# Altium schematic sheet ESP32.SchDoc
size A; SheetNumber: 6; SheetTotal: 9
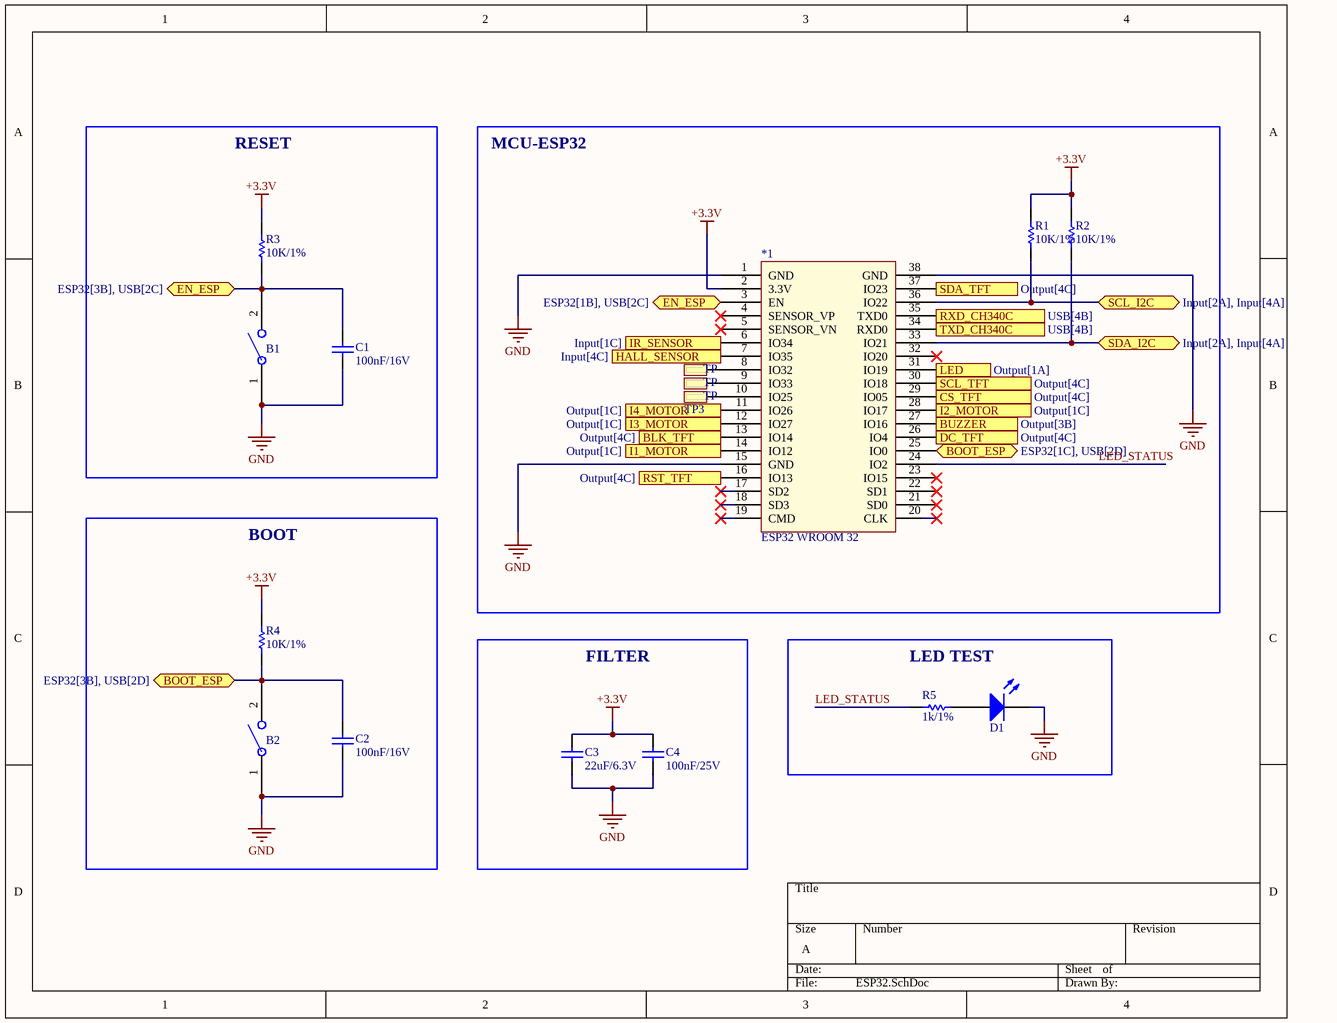
[diagram p0: ESP32.SchDoc]

## Parts
*1  ESP32 WROOM 32  [ESP32-WROOM-32D]
B1  Button SMD 2 Pin 3x4mm  [BUTTON SMD 2 PIN]  (value not drawn)
B2  Button SMD 2 Pin 3x4mm  [BUTTON SMD 2 PIN]  (value not drawn)
C1  value 100nF/16V  [CAP-SM-0805]  (hidden comment: Cap Non-Pol SMD)
C2  value 100nF/16V  [CAP-SM-0805]  (hidden comment: Cap Non-Pol SMD)
C3  value 22uF/6.3V  [CAP-SM-0805]  (hidden comment: Cap Non-Pol SMD)
C4  value 100nF/25V  [CAP-SM-0805]  (hidden comment: Cap Non-Pol SMD)
D1  LED SMD  [LED_0805_Blue]  (value not drawn)
R1  value 10K/1%  [RES-SM-0805]  (hidden comment: RESISTOR SMD)
R2  value 10K/1%  [RES-SM-0805]  (hidden comment: RESISTOR SMD)
R3  value 10K/1%  [RES-SM-0805]  (hidden comment: RESISTOR SMD)
R4  value 10K/1%  [RES-SM-0805]  (hidden comment: RESISTOR SMD)
R5  value 1k/1%  [RES-SM-0805]  (hidden comment: RESISTOR SMD)
TP1  Test Point  [TP]  (value not drawn)
TP2  Test Point  [TP]  (value not drawn)
TP3  Test Point  [TP]  (value not drawn)

## Blocks framed on the sheet
RESET: B1 C1 R3
MCU-ESP32: *1 R1 R2 TP1-TP3
BOOT: B2 C2 R4
FILTER: C3 C4
LED TEST: D1 R5

## Ports
BLK_TFT (out, see Output[4C]), BOOT_ESP (bidir, see ESP32[1C], USB[2D]), BOOT_ESP (bidir, see ESP32[3B], USB[2D]), BUZZER (out, see Output[3B]), CS_TFT (out, see Output[4C]), DC_TFT (out, see Output[4C]), EN_ESP (bidir, see ESP32[1B], USB[2C]), EN_ESP (bidir, see ESP32[3B], USB[2C]), HALL_SENSOR (in, see Input[4C]), I1_MOTOR (out, see Output[1C]), I2_MOTOR (out, see Output[1C]), I3_MOTOR (out, see Output[1C]), I4_MOTOR (out, see Output[1C]), IR_SENSOR (in, see Input[1C]), LED (out, see Output[1A]), RST_TFT (out, see Output[4C]), RXD_CH340C (out, see USB[4B]), SCL_I2C (bidir, see Input[2A], Input[4A]), SCL_TFT (out, see Output[4C]), SDA_I2C (bidir, see Input[2A], Input[4A]), SDA_TFT (out, see Output[4C]), TXD_CH340C (in, see USB[4B])

## Nets
+3.3V: *1.2(3.3V) C3.2 C4.2 R1.1 R2.1 R3.1 R4.1
GND: *1.1(GND) *1.15(GND) *1.38(GND) B1.1 B2.1 C1.1 C2.1 C3.1 C4.1 D1.2(K)
BLK_TFT: *1.13(IO14) ; port BLK_TFT
BOOT_ESP: *1.25(IO0) B2.2 C2.2 R4.2 ; port BOOT_ESP
BUZZER: *1.27(IO16) ; port BUZZER
CS_TFT: *1.29(IO05) ; port CS_TFT
DC_TFT: *1.26(IO4) ; port DC_TFT
EN_ESP: *1.3(EN) B1.2 C1.2 R3.2 ; port EN_ESP
HALL_SENSOR: *1.7(IO35) ; port HALL_SENSOR
I1_MOTOR: *1.14(IO12) ; port I1_MOTOR
I2_MOTOR: *1.28(IO17) ; port I2_MOTOR
I3_MOTOR: *1.12(IO27) ; port I3_MOTOR
I4_MOTOR: *1.11(IO26) ; port I4_MOTOR
IR_SENSOR: *1.6(IO34) ; port IR_SENSOR
LED: *1.31(IO19) ; port LED
LED_STATUS: *1.24(IO2) R5.1
RST_TFT: *1.16(IO13) ; port RST_TFT
RXD_CH340C: *1.35(TXD0) ; port RXD_CH340C
SCL_I2C: *1.36(IO22) R1.2 ; port SCL_I2C
SCL_TFT: *1.30(IO18) ; port SCL_TFT
SDA_I2C: *1.33(IO21) R2.2 ; port SDA_I2C
SDA_TFT: *1.37(IO23) ; port SDA_TFT
TXD_CH340C: *1.34(RXD0) ; port TXD_CH340C
Net*1_8: *1.8(IO32) TP1.TP1
Net*1_9: *1.9(IO33) TP2.TP1
Net*1_10: *1.10(IO25) TP3.TP1
NetD1_1: D1.1(A) R5.2

Not connected (* = marked no-connect by the designer): *1 4(SENSOR_VP)* 5(SENSOR_VN)* 17(SD2)* 18(SD3)* 19(CMD)* 20(CLK)* 21(SD0)* 22(SD1)* 23(IO15)* 32(IO20)*

## Notes on the sheet
- (in symbol Test Point) TP

## Library data of the parts
B1 B2 = BUTTON
C1-C4 = Cap Non-Pol SMD: Capacitor
D1 = LED SMD: LED
R1-R5 = RESISTOR SMD: Resistor